# Altium project 1712_Peleng_Mez.PrjPcb
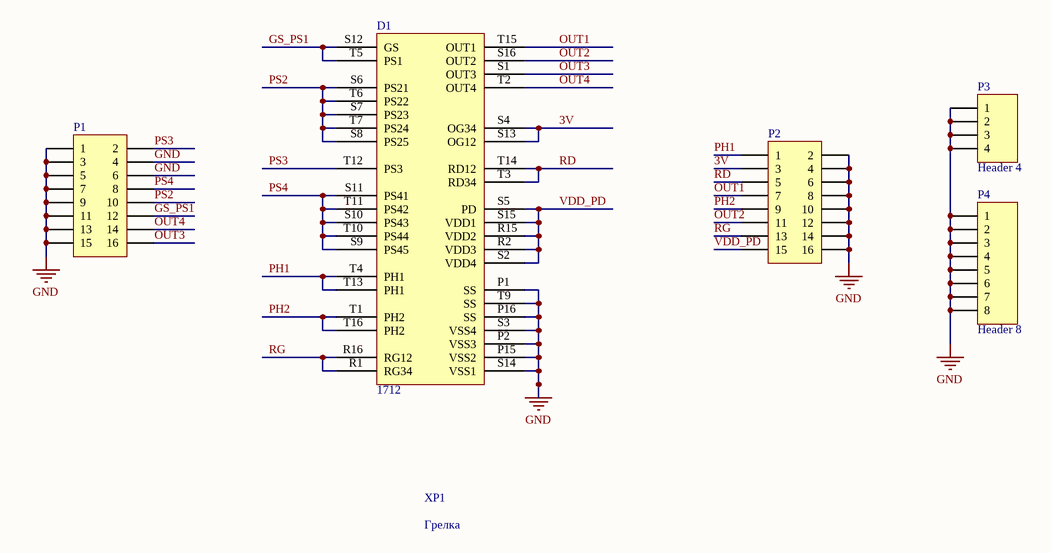
[diagram p0: 1712_Mez.SchDoc]
1 sheet, 6 parts. Net scope: global (net labels, ports and power ports of the same name join across sheets).
Board file: 1712_Mez.PcbDoc

## Sheet 1712_Mez.SchDoc
size A4; SheetNumber: 1; SheetTotal: 1

### Parts
D1  1712(PC)  [Dzr_place]  (value not drawn)
P1  Header 8X2  [HDR2X8]  (value not drawn)
P2  Header 8X2  [HDR2X8]  (value not drawn)
P3  Header 4  [HDR1X4]
P4  Header 8  [HDR1X8]
XP1  Грелка  [Грелка]

### Nets
GND: D1.P1(SS) D1.P2(VSS3) D1.P15(VSS2) D1.P16(SS) D1.S3(VSS4) D1.S14(VSS1) D1.T9(SS) P1.1 P1.3 P1.4 P1.5 P1.6 P1.7 P1.9 P1.11 P1.13 P1.15 P2.2 P2.4 P2.6 P2.8 P2.10 P2.12 P2.14 P2.16 P3.1 P3.2 P3.3 P3.4 P4.1 P4.2 P4.3 P4.4 P4.5 P4.6 P4.7 P4.8
3V: D1.S4(OG34) D1.S13(OG12) P2.3
GS_PS1: D1.S12(GS) D1.T5(PS1) P1.12
OUT1: D1.T15(OUT1) P2.7
OUT2: D1.S16(OUT2) P2.11
OUT3: D1.S1(OUT3) P1.16
OUT4: D1.T2(OUT4) P1.14
PH1: D1.T4(PH1) D1.T13(PH1) P2.1
PH2: D1.T1(PH2) D1.T16(PH2) P2.9
PS2: D1.S6(PS21) D1.S7(PS23) D1.S8(PS25) D1.T6(PS22) D1.T7(PS24) P1.10
PS3: D1.T12(PS3) P1.2
PS4: D1.S9(PS45) D1.S10(PS43) D1.S11(PS41) D1.T10(PS44) D1.T11(PS42) P1.8
RD: D1.T3(RD34) D1.T14(RD12) P2.5
RG: D1.R1(RG34) D1.R16(RG12) P2.13
VDD_PD: D1.R2(VDD3) D1.R15(VDD2) D1.S2(VDD4) D1.S5(PD) D1.S15(VDD1) P2.15

### Notes on the sheet
- (near D1) 1712

### Library data of the parts
D1 = Б1712А-3
P1 P2 = Header 8X2: Header, 8-Pin, Dual row; LatestRevisionDate: 17-Jul-2002; LatestRevisionNote: Re-released for DXP Platform.; Publisher: Altium Limited
P3 = Header 4: Header, 4-Pin; LatestRevisionDate: 17-Jul-2002; LatestRevisionNote: Re-released for DXP Platform.; Publisher: Altium Limited
P4 = Header 8: Header, 8-Pin; LatestRevisionDate: 17-Jul-2002; LatestRevisionNote: Re-released for DXP Platform.; Publisher: Altium Limited